# Altium project MVP-Dash-v1.0.PrjPcb (part 4 of 15)

## Sheet RK3568-DDR-PHY.SchDoc
size 420 x 297 mm; SheetNumber: 5; SheetTotal: 25
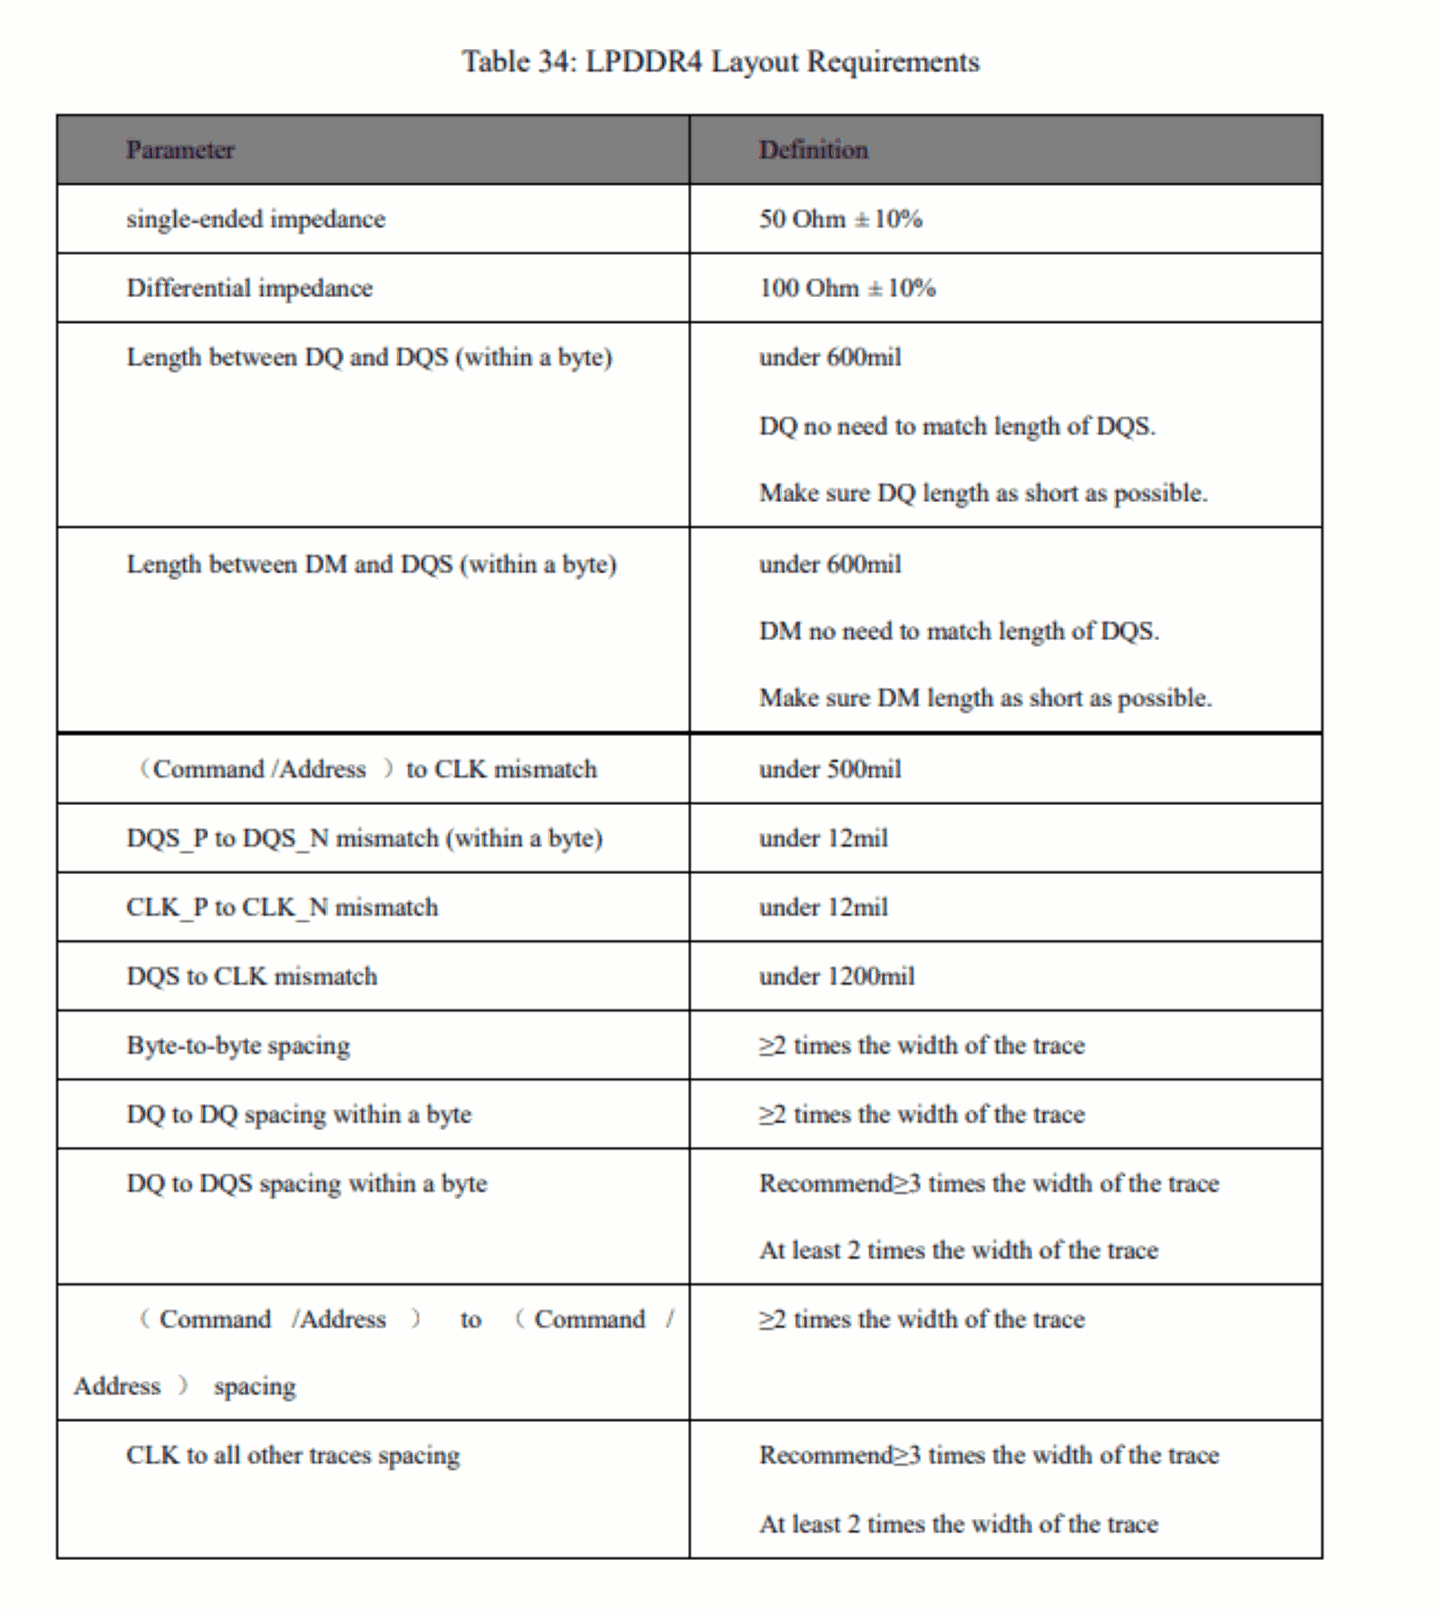
[diagram p4: RK3568-DDR-PHY.SchDoc, left]
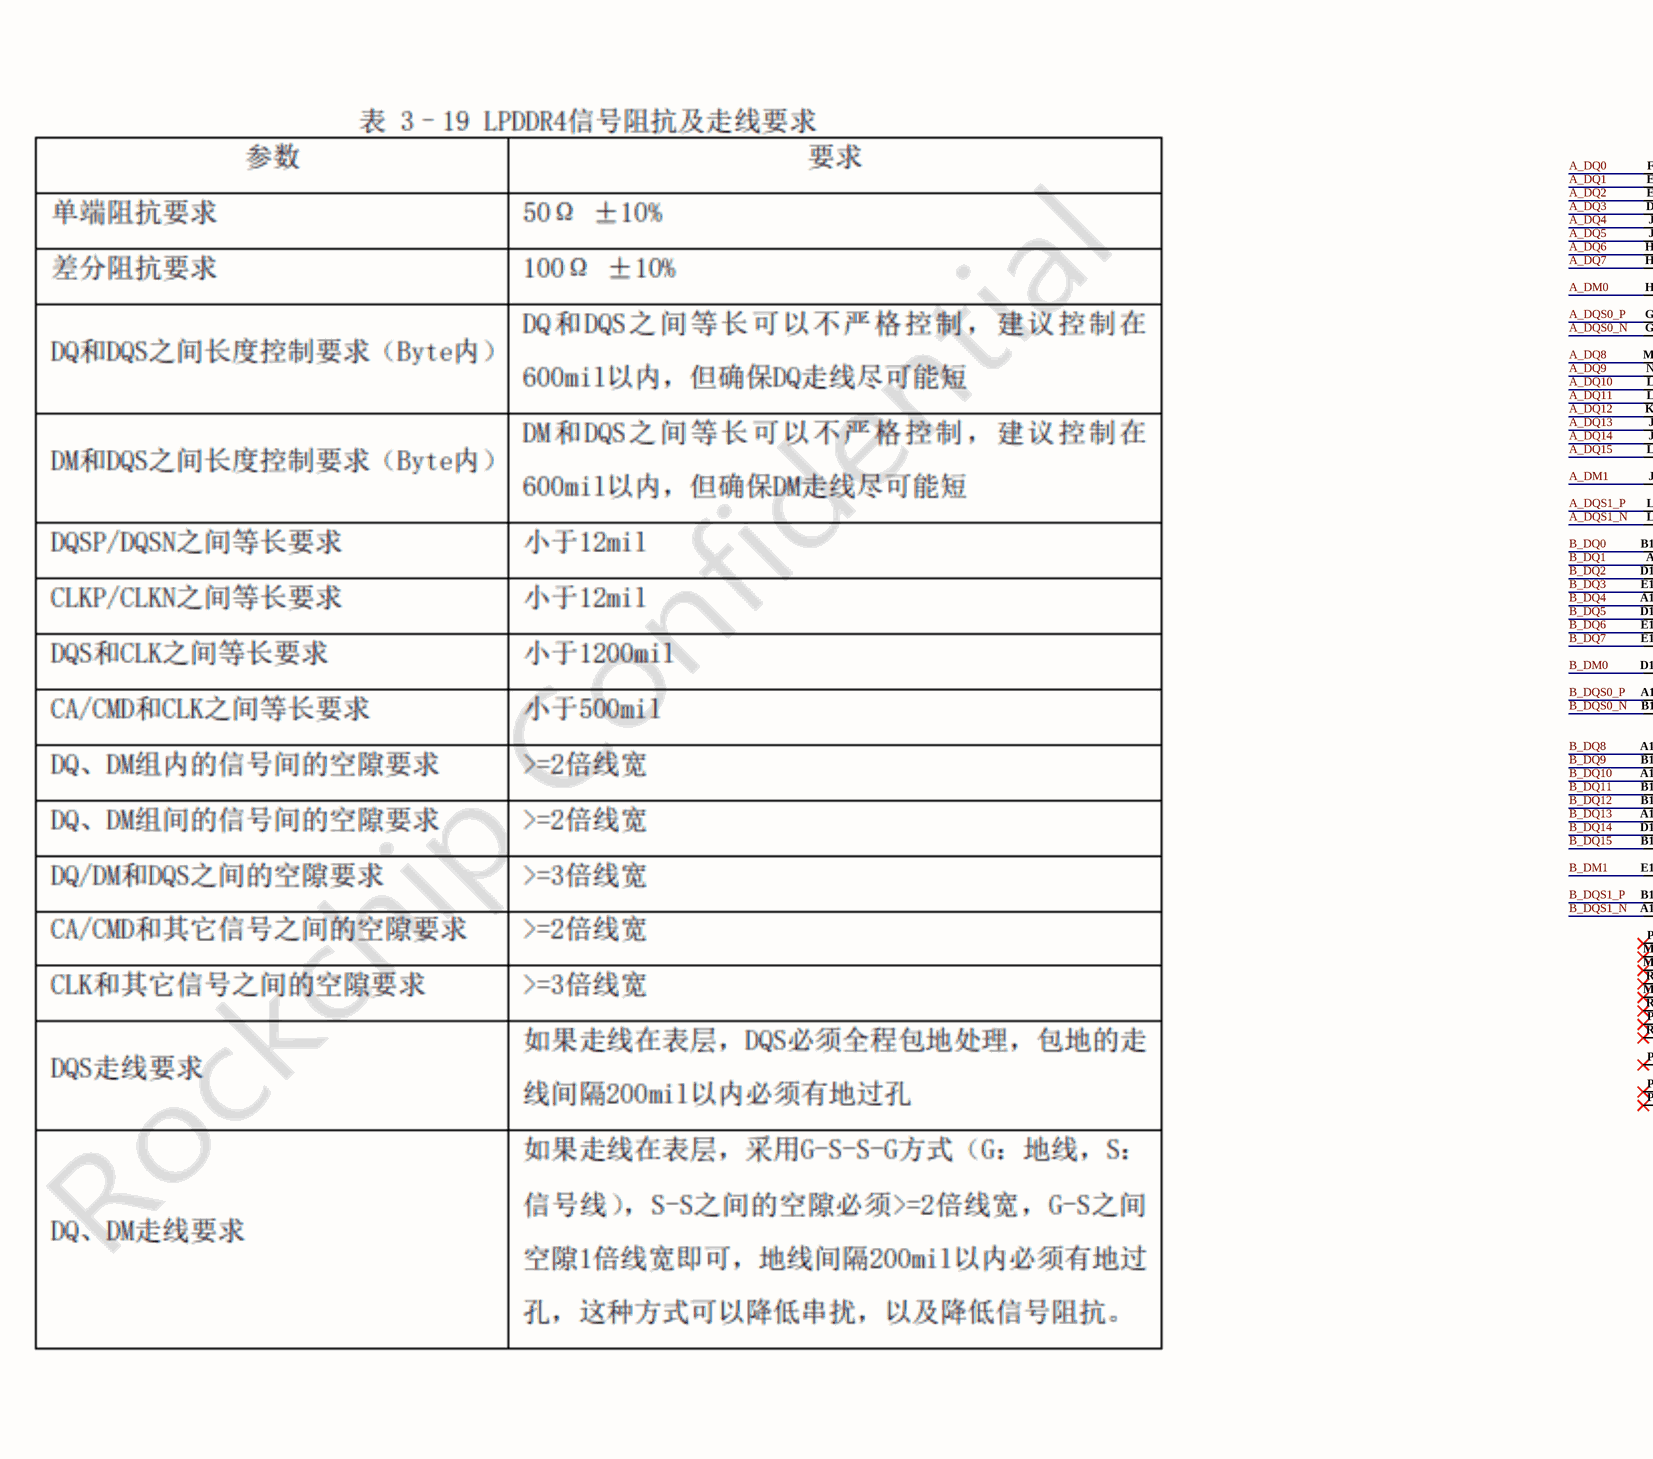
[diagram p5: RK3568-DDR-PHY.SchDoc, middle]
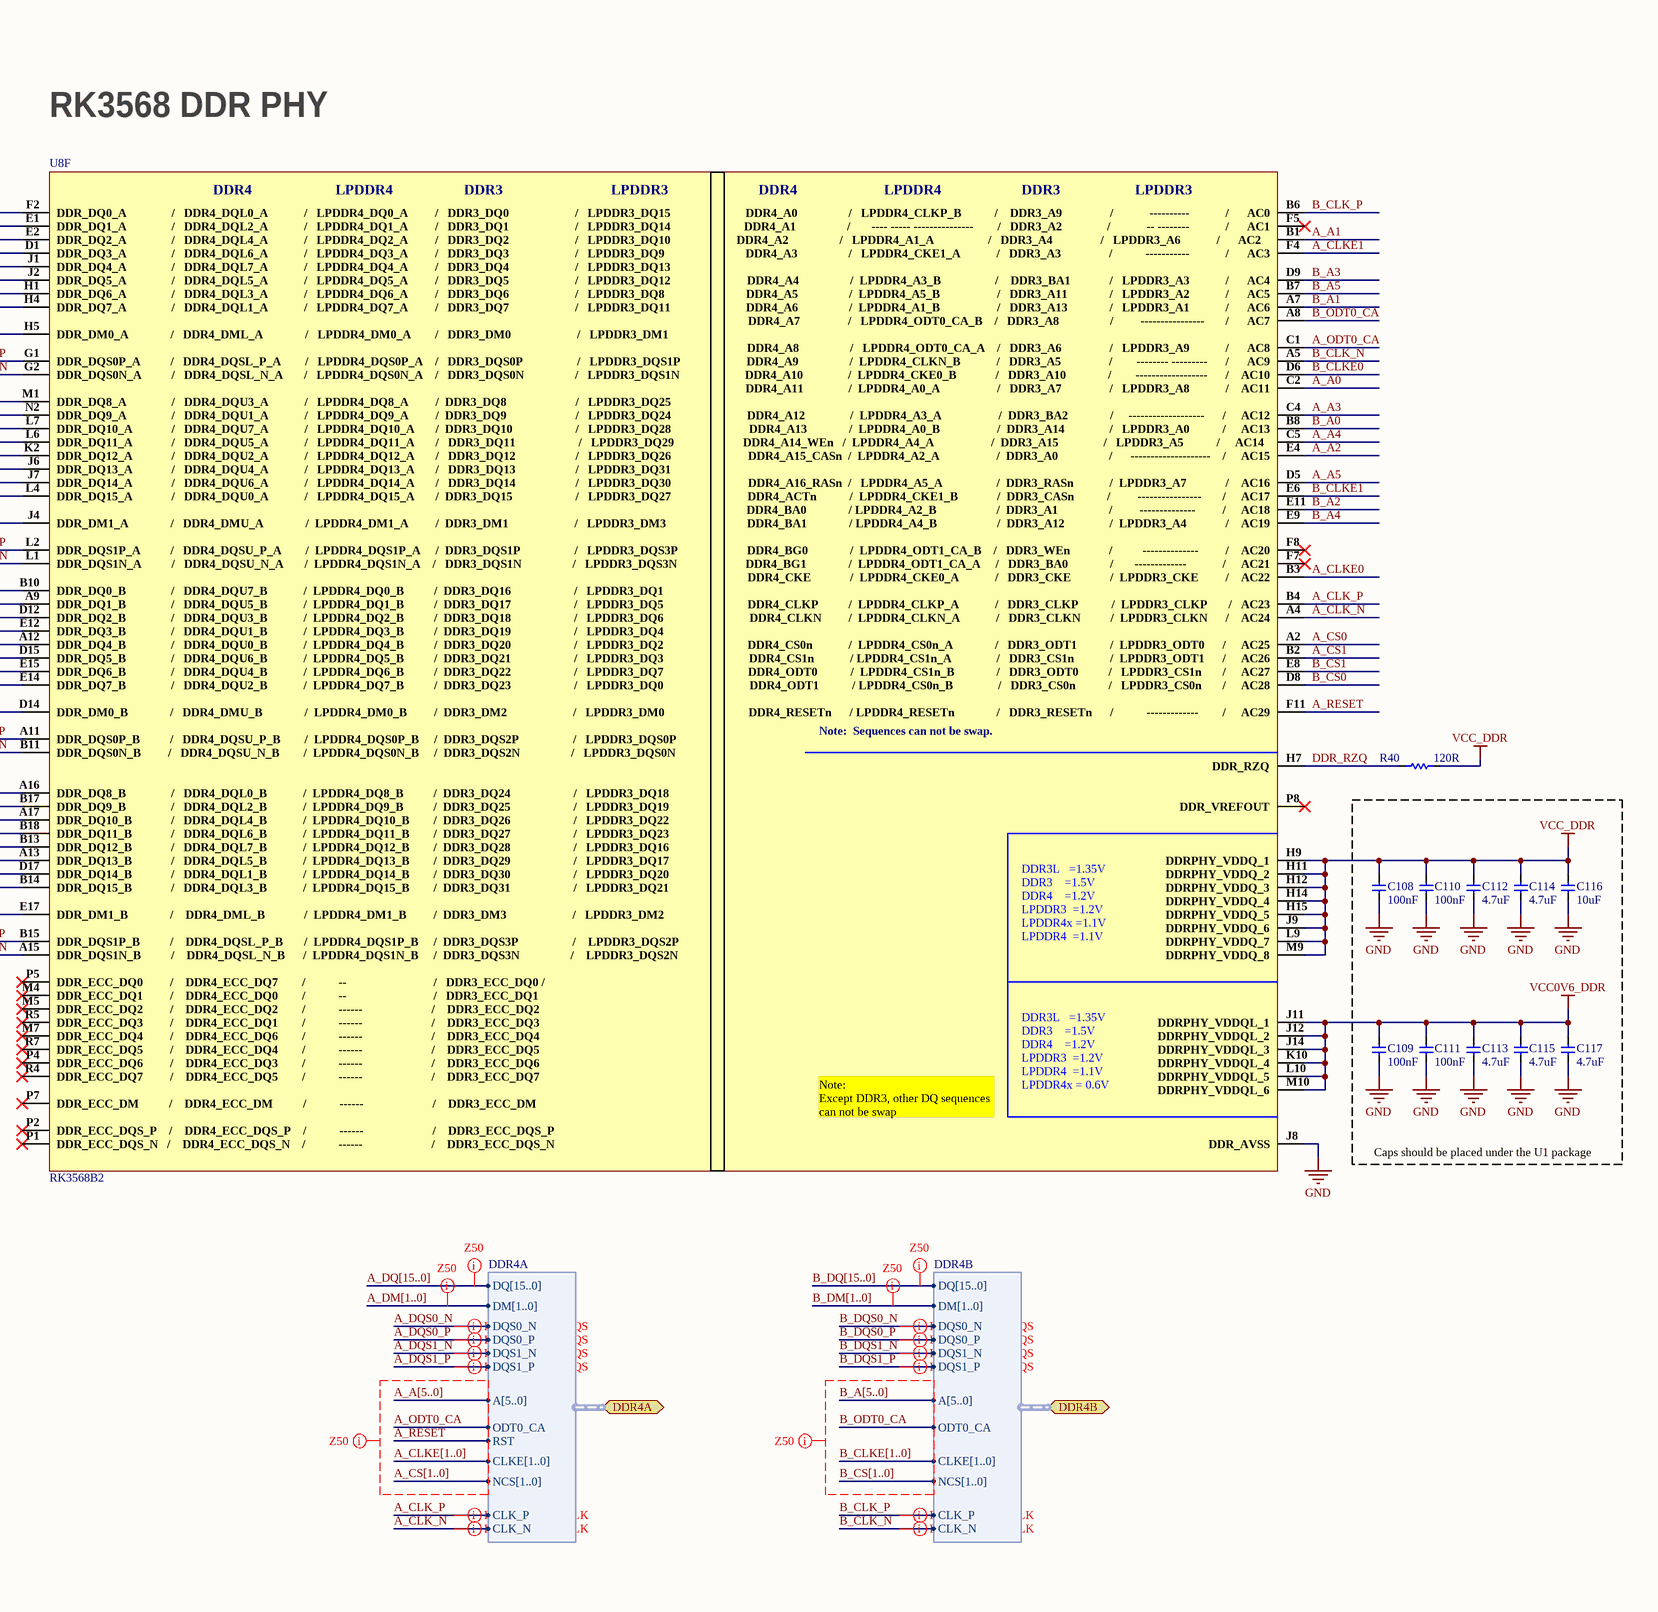
[diagram p6: RK3568-DDR-PHY.SchDoc, right]

### Parts
C108  100nF  [CAP-0201]
C109  100nF  [CAP-0201]
C110  100nF  [CAP-0201]
C111  100nF  [CAP-0201]
C112  4.7uF  [Cap-0402]
C113  4.7uF  [Cap-0402]
C114  4.7uF  [Cap-0402]
C115  4.7uF  [Cap-0402]
C116  10uF  [Cap-0603]
C117  4.7uF  [Cap-0402]
R40  120R  [Res-0201]
U8  RK3568B2  [FCCSP-636L]  (part F of 23)

### Ports
DDR4A (bidir, harness DDR4A, see DRAM-LPDDR4x-Sheet[2A]), DDR4B (bidir, harness DDR4B, see DRAM-LPDDR4x-Sheet[2B])

### Harnesses
DDR4A: DQ[15..0], DM[1..0], DQS0_N, DQS0_P, DQS1_N, DQS1_P, A[5..0], ODT0_CA, RST, CLKE[1..0], NCS[1..0], CLK_P, CLK_N
DDR4B: DQ[15..0], DM[1..0], DQS0_N, DQS0_P, DQS1_N, DQS1_P, A[5..0], ODT0_CA, CLKE[1..0], NCS[1..0], CLK_P, CLK_N

### Nets
GND: C108.1 C109.1 C110.1 C111.1 C112.1 C113.1 C114.1 C115.1 C116.1 C117.1 U8.J8(DDR_AVSS)
VCC0V6_DDR: C109.2 C111.2 C113.2 C115.2 C117.2 U8.J11(DDRPHY_VDDQL_1) U8.J12(DDRPHY_VDDQL_2) U8.J14(DDRPHY_VDDQL_3) U8.K10(DDRPHY_VDDQL_4) U8.L10(DDRPHY_VDDQL_5) U8.M10(DDRPHY_VDDQL_6)
VCC_DDR: C108.2 C110.2 C112.2 C114.2 C116.2 R40.2 U8.H9(DDRPHY_VDDQ_1) U8.H11(DDRPHY_VDDQ_2) U8.H12(DDRPHY_VDDQ_3) U8.H14(DDRPHY_VDDQ_4) U8.H15(DDRPHY_VDDQ_5) U8.J9(DDRPHY_VDDQ_6) U8.L9(DDRPHY_VDDQ_7) U8.M9(DDRPHY_VDDQ_8)
A_A0: U8.C2(DDR4_A11_______________/__LPDDR4_A0_A___________________/___DDR3_A7________________/___LPDDR3_A8____________/____AC11)
A_A1: U8.B1(DDR4_A2_________________/___LPDDR4_A1_A__________________/___DDR3_A4________________/___LPDDR3_A6____________/______AC2)
A_A2: U8.E4(DDR4_A15_CASn__/__LPDDR4_A2_A___________________/__DDR3_A0_________________/______--------------------____/_____AC15)
A_A3: U8.C4(DDR4_A12_______________/__LPDDR4_A3_A___________________/__DDR3_BA2______________/_____-------------------______/_____AC12)
A_A4: U8.C5(DDR4_A14_WEn___/__LPDDR4_A4_A___________________/__DDR3_A15_______________/___LPDDR3_A5___________/_____AC14)
A_A5: U8.D5(DDR4_A16_RASn__/___LPDDR4_A5_A__________________/__DDR3_RASn____________/__LPDDR3_A7_____________/____AC16)
A_CLK_N: U8.A4(DDR4_CLKN_________/__LPDDR4_CLKN_A____________/___DDR3_CLKN__________/__LPDDR3_CLKN______/____AC24) ; port DDR4A.CLK_N
A_CLK_P: U8.B4(DDR4_CLKP__________/__LPDDR4_CLKP_A____________/___DDR3_CLKP___________/__LPDDR3_CLKP_______/___AC23) ; port DDR4A.CLK_P
A_CLKE0: U8.B3(DDR4_CKE_____________/__LPDDR4_CKE0_A____________/___DDR3_CKE_____________/__LPDDR3_CKE_________/____AC22)
A_CLKE1: U8.F4(DDR4_A3_________________/___LPDDR4_CKE1_A____________/___DDR3_A3________________/___________-----------____________/______AC3)
A_CS0: U8.A2(DDR4_CS0n____________/__LPDDR4_CS0n_A______________/___DDR3_ODT1___________/__LPDDR3_ODT0______/_____AC25)
A_CS1: U8.B2(DDR4_CS1n____________/_LPDDR4_CS1n_A_______________/___DDR3_CS1n____________/__LPDDR3_ODT1______/_____AC26)
A_DM0: U8.H5(DDR_DM0_A______________/___DDR4_DML_A______________/___LPDDR4_DM0_A________/___DDR3_DM0______________________/___LPDDR3_DM1)
A_DM1: U8.J4(DDR_DM1_A______________/___DDR4_DMU_A______________/__LPDDR4_DM1_A_________/__DDR3_DM1______________________/___LPDDR3_DM3)
A_DQ0: U8.F2(DDR_DQ0_A_______________/___DDR4_DQL0_A____________/___LPDDR4_DQ0_A_________/___DDR3_DQ0______________________/___LPDDR3_DQ15)
A_DQ1: U8.E1(DDR_DQ1_A_______________/___DDR4_DQL2_A____________/___LPDDR4_DQ1_A_________/___DDR3_DQ1______________________/___LPDDR3_DQ14)
A_DQ2: U8.E2(DDR_DQ2_A_______________/___DDR4_DQL4_A____________/___LPDDR4_DQ2_A_________/___DDR3_DQ2______________________/___LPDDR3_DQ10)
A_DQ3: U8.D1(DDR_DQ3_A_______________/___DDR4_DQL6_A____________/___LPDDR4_DQ3_A_________/___DDR3_DQ3______________________/___LPDDR3_DQ9)
A_DQ4: U8.J1(DDR_DQ4_A_______________/___DDR4_DQL7_A____________/___LPDDR4_DQ4_A_________/___DDR3_DQ4______________________/___LPDDR3_DQ13)
A_DQ5: U8.J2(DDR_DQ5_A_______________/___DDR4_DQL5_A____________/___LPDDR4_DQ5_A_________/___DDR3_DQ5______________________/___LPDDR3_DQ12)
A_DQ6: U8.H1(DDR_DQ6_A_______________/___DDR4_DQL3_A____________/___LPDDR4_DQ6_A_________/___DDR3_DQ6______________________/___LPDDR3_DQ8)
A_DQ7: U8.H4(DDR_DQ7_A_______________/___DDR4_DQL1_A____________/___LPDDR4_DQ7_A_________/___DDR3_DQ7______________________/___LPDDR3_DQ11)
A_DQ8: U8.M1(DDR_DQ8_A_______________/___DDR4_DQU3_A____________/___LPDDR4_DQ8_A_________/__DDR3_DQ8_______________________/___LPDDR3_DQ25)
A_DQ9: U8.N2(DDR_DQ9_A_______________/___DDR4_DQU1_A____________/___LPDDR4_DQ9_A_________/__DDR3_DQ9_______________________/___LPDDR3_DQ24)
A_DQ10: U8.L7(DDR_DQ10_A_____________/___DDR4_DQU7_A____________/___LPDDR4_DQ10_A_______/__DDR3_DQ10_____________________/___LPDDR3_DQ28)
A_DQ11: U8.L6(DDR_DQ11_A_____________/___DDR4_DQU5_A____________/___LPDDR4_DQ11_A_______/___DDR3_DQ11_____________________/___LPDDR3_DQ29)
A_DQ12: U8.K2(DDR_DQ12_A_____________/___DDR4_DQU2_A____________/___LPDDR4_DQ12_A_______/___DDR3_DQ12____________________/___LPDDR3_DQ26)
A_DQ13: U8.J6(DDR_DQ13_A_____________/___DDR4_DQU4_A____________/___LPDDR4_DQ13_A_______/___DDR3_DQ13____________________/___LPDDR3_DQ31)
A_DQ14: U8.J7(DDR_DQ14_A_____________/___DDR4_DQU6_A____________/___LPDDR4_DQ14_A_______/___DDR3_DQ14____________________/___LPDDR3_DQ30)
A_DQ15: U8.L4(DDR_DQ15_A_____________/___DDR4_DQU0_A____________/___LPDDR4_DQ15_A_______/__DDR3_DQ15_____________________/___LPDDR3_DQ27)
A_DQS0_N: U8.G2(DDR_DQS0N_A__________/___DDR4_DQSL_N_A_______/___LPDDR4_DQS0N_A____/___DDR3_DQS0N_________________/___LPDDR3_DQS1N) ; port DDR4A.DQS0_N
A_DQS0_P: U8.G1(DDR_DQS0P_A__________/___DDR4_DQSL_P_A________/___LPDDR4_DQS0P_A____/___DDR3_DQS0P__________________/___LPDDR3_DQS1P) ; port DDR4A.DQS0_P
A_DQS1_N: U8.L1(DDR_DQS1N_A__________/___DDR4_DQSU_N_A_______/__LPDDR4_DQS1N_A____/___DDR3_DQS1N_________________/___LPDDR3_DQS3N) ; port DDR4A.DQS1_N
A_DQS1_P: U8.L2(DDR_DQS1P_A__________/___DDR4_DQSU_P_A________/__LPDDR4_DQS1P_A_____/__DDR3_DQS1P__________________/___LPDDR3_DQS3P) ; port DDR4A.DQS1_P
A_ODT0_CA: U8.C1(DDR4_A8_________________/___LPDDR4_ODT0_CA_A____/___DDR3_A6________________/___LPDDR3_A9____________/______AC8) ; port DDR4A.ODT0_CA
A_RESET: U8.F11(DDR4_RESETn______/_LPDDR4_RESETn______________/___DDR3_RESETn______/___________-------------________/_____AC29) ; port DDR4A.RST
B_A0: U8.B8(DDR4_A13______________/__LPDDR4_A0_B___________________/__DDR3_A14_______________/___LPDDR3_A0___________/_____AC13)
B_A1: U8.A7(DDR4_A6_________________/__LPDDR4_A1_B___________________/___DDR3_A13______________/___LPDDR3_A1____________/______AC6)
B_A2: U8.E11(DDR4_BA0______________/_LPDDR4_A2_B____________________/__DDR3_A1_________________/_________--------------_________/_____AC18)
B_A3: U8.D9(DDR4_A4_________________/__LPDDR4_A3_B__________________/____DDR3_BA1_____________/___LPDDR3_A3____________/______AC4)
B_A4: U8.E9(DDR4_BA1______________/_LPDDR4_A4_B____________________/__DDR3_A12_______________/__LPDDR3_A4_____________/____AC19)
B_A5: U8.B7(DDR4_A5_________________/__LPDDR4_A5_B___________________/___DDR3_A11______________/___LPDDR3_A2____________/______AC5)
B_CLK_N: U8.A5(DDR4_A9_________________/__LPDDR4_CLKN_B____________/___DDR3_A5________________/________--------_---------______/______AC9) ; port DDR4B.CLK_N
B_CLK_P: U8.B6(DDR4_A0_________________/___LPDDR4_CLKP_B___________/____DDR3_A9________________/____________----------____________/______AC0) ; port DDR4B.CLK_P
B_CLKE0: U8.D6(DDR4_A10_______________/__LPDDR4_CKE0_B_____________/___DDR3_A10______________/________------------------______/____AC10)
B_CLKE1: U8.E6(DDR4_ACTn___________/__LPDDR4_CKE1_B_____________/__DDR3_CASn___________/_________----------------_______/_____AC17)
B_CS0: U8.D8(DDR4_ODT1___________/_LPDDR4_CS0n_B_______________/___DDR3_CS0n___________/___LPDDR3_CS0n_______/_____AC28)
B_CS1: U8.E8(DDR4_ODT0___________/__LPDDR4_CS1n_B______________/___DDR3_ODT0__________/___LPDDR3_CS1n_______/_____AC27)
B_DM0: U8.D14(DDR_DM0_B______________/___DDR4_DMU_B______________/__LPDDR4_DM0_B_________/__DDR3_DM2______________________/___LPDDR3_DM0)
B_DM1: U8.E17(DDR_DM1_B______________/____DDR4_DML_B_____________/__LPDDR4_DM1_B_________/__DDR3_DM3______________________/___LPDDR3_DM2)
B_DQ0: U8.B10(DDR_DQ0_B_______________/___DDR4_DQU7_B____________/__LPDDR4_DQ0_B__________/__DDR3_DQ16_____________________/___LPDDR3_DQ1)
B_DQ1: U8.A9(DDR_DQ1_B_______________/___DDR4_DQU5_B____________/__LPDDR4_DQ1_B__________/__DDR3_DQ17_____________________/___LPDDR3_DQ5)
B_DQ2: U8.D12(DDR_DQ2_B_______________/___DDR4_DQU3_B____________/__LPDDR4_DQ2_B__________/__DDR3_DQ18_____________________/___LPDDR3_DQ6)
B_DQ3: U8.E12(DDR_DQ3_B_______________/___DDR4_DQU1_B____________/__LPDDR4_DQ3_B__________/__DDR3_DQ19_____________________/___LPDDR3_DQ4)
B_DQ4: U8.A12(DDR_DQ4_B_______________/___DDR4_DQU0_B____________/__LPDDR4_DQ4_B__________/__DDR3_DQ20_____________________/___LPDDR3_DQ2)
B_DQ5: U8.D15(DDR_DQ5_B_______________/___DDR4_DQU6_B____________/__LPDDR4_DQ5_B__________/__DDR3_DQ21_____________________/___LPDDR3_DQ3)
B_DQ6: U8.E15(DDR_DQ6_B_______________/___DDR4_DQU4_B____________/__LPDDR4_DQ6_B__________/__DDR3_DQ22_____________________/___LPDDR3_DQ7)
B_DQ7: U8.E14(DDR_DQ7_B_______________/___DDR4_DQU2_B____________/__LPDDR4_DQ7_B__________/__DDR3_DQ23_____________________/___LPDDR3_DQ0)
B_DQ8: U8.A16(DDR_DQ8_B_______________/___DDR4_DQL0_B____________/__LPDDR4_DQ8_B__________/__DDR3_DQ24_____________________/___LPDDR3_DQ18)
B_DQ9: U8.B17(DDR_DQ9_B_______________/___DDR4_DQL2_B____________/__LPDDR4_DQ9_B__________/__DDR3_DQ25_____________________/___LPDDR3_DQ19)
B_DQ10: U8.A17(DDR_DQ10_B_____________/___DDR4_DQL4_B____________/__LPDDR4_DQ10_B________/__DDR3_DQ26_____________________/___LPDDR3_DQ22)
B_DQ11: U8.B18(DDR_DQ11_B_____________/___DDR4_DQL6_B____________/__LPDDR4_DQ11_B________/__DDR3_DQ27_____________________/___LPDDR3_DQ23)
B_DQ12: U8.B13(DDR_DQ12_B_____________/___DDR4_DQL7_B____________/__LPDDR4_DQ12_B________/__DDR3_DQ28_____________________/___LPDDR3_DQ16)
B_DQ13: U8.A13(DDR_DQ13_B_____________/___DDR4_DQL5_B____________/__LPDDR4_DQ13_B________/__DDR3_DQ29_____________________/___LPDDR3_DQ17)
B_DQ14: U8.D17(DDR_DQ14_B_____________/___DDR4_DQL1_B____________/__LPDDR4_DQ14_B________/__DDR3_DQ30_____________________/___LPDDR3_DQ20)
B_DQ15: U8.B14(DDR_DQ15_B_____________/___DDR4_DQL3_B____________/__LPDDR4_DQ15_B________/__DDR3_DQ31_____________________/___LPDDR3_DQ21)
B_DQS0_N: U8.B11(DDR_DQS0N_B_________/___DDR4_DQSU_N_B________/__LPDDR4_DQS0N_B_____/__DDR3_DQS2N_________________/___LPDDR3_DQS0N) ; port DDR4B.DQS0_N
B_DQS0_P: U8.A11(DDR_DQS0P_B__________/___DDR4_DQSU_P_B________/__LPDDR4_DQS0P_B_____/__DDR3_DQS2P__________________/___LPDDR3_DQS0P) ; port DDR4B.DQS0_P
B_DQS1_N: U8.A15(DDR_DQS1N_B__________/____DDR4_DQSL_N_B______/__LPDDR4_DQS1N_B_____/__DDR3_DQS3N_________________/____LPDDR3_DQS2N) ; port DDR4B.DQS1_N
B_DQS1_P: U8.B15(DDR_DQS1P_B__________/____DDR4_DQSL_P_B_______/__LPDDR4_DQS1P_B_____/__DDR3_DQS3P__________________/____LPDDR3_DQS2P) ; port DDR4B.DQS1_P
B_ODT0_CA: U8.A8(DDR4_A7________________/___LPDDR4_ODT0_CA_B____/___DDR3_A8_________________/_________----------------_______/______AC7) ; port DDR4B.ODT0_CA
DDR_RZQ: R40.1 U8.H7(DDR_RZQ)

Not connected (* = marked no-connect by the designer): U8 F5(DDR4_A1_________________/_______----_-----_---------------________/___DDR3_A2_______________/____________--_--------____________/______AC1)* F7(DDR4_BG1______________/__LPDDR4_ODT1_CA_A_____/___DDR3_BA0______________/_______-------------____________/_____AC21)* F8(DDR4_BG0______________/__LPDDR4_ODT1_CA_B____/___DDR3_WEn_____________/__________--------------_________/____AC20)* M4(DDR_ECC_DQ1_________/____DDR4_ECC_DQ0________/___________--_____________________________/___DDR3_ECC_DQ1)* M5(DDR_ECC_DQ2_________/____DDR4_ECC_DQ2________/___________------_______________________/____DDR3_ECC_DQ2)* M7(DDR_ECC_DQ4_________/____DDR4_ECC_DQ6________/___________------_______________________/____DDR3_ECC_DQ4)* P1(DDR_ECC_DQS_N___/____DDR4_ECC_DQS_N____/___________------_______________________/____DDR3_ECC_DQS_N)* P2(DDR_ECC_DQS_P____/____DDR4_ECC_DQS_P____/___________------_______________________/____DDR3_ECC_DQS_P)* P4(DDR_ECC_DQ6_________/____DDR4_ECC_DQ3________/___________------_______________________/____DDR3_ECC_DQ6)* P5(DDR_ECC_DQ0_________/____DDR4_ECC_DQ7________/___________--_____________________________/___DDR3_ECC_DQ0_/________)* P7(DDR_ECC_DM__________/____DDR4_ECC_DM__________/___________------_______________________/____DDR3_ECC_DM)* P8(DDR_VREFOUT)* R4(DDR_ECC_DQ7_________/____DDR4_ECC_DQ5________/___________------_______________________/____DDR3_ECC_DQ7)* R5(DDR_ECC_DQ3_________/____DDR4_ECC_DQ1________/___________------_______________________/____DDR3_ECC_DQ3)* R7(DDR_ECC_DQ5_________/____DDR4_ECC_DQ4________/___________------_______________________/____DDR3_ECC_DQ5)*

### Buses and harness runs
bus A_A[5..0]
bus A_CLKE[1..0]
bus A_CS[1..0]
bus A_DM[1..0]
bus A_DQ[15..0]
bus B_A[5..0]
bus B_CLKE[1..0]
bus B_CS[1..0]
bus B_DM[1..0]
bus B_DQ[15..0]

### Layout directives
net class 50OHM_DDR: (no net found under the mark), A_A[5..0], A_CLKE[1..0], A_CS[1..0], A_ODT0_CA, A_RESET, B_A[5..0], B_CLKE[1..0], B_CS[1..0], B_ODT0_CA
differential pair; differential pair class 100OHM_DDR_DQS: A_DQS0_N, A_DQS0_P, A_DQS1_N, A_DQS1_P, B_DQS0_N, B_DQS0_P, B_DQS1_N, B_DQS1_P
differential pair; differential pair class 100OHM_DDR_CLK: A_CLK_N, A_CLK_P, B_CLK_N, B_CLK_P

### Notes on the sheet
- RK3568 DDR PHY
- Caps should be placed under the U1 package
- File:
- Title:
- Date:
- Page
- Num:
- Total:
- Drawn By: Huzaifa Ali
- (in symbol RK3568B2, part F) DDR4; LPDDR4; DDR3; LPDDR3; Note:  Sequences can not be swap.; DDR3L   =1.35V / DDR3    =1.5V / DDR4    =1.2V / LPDDR3  =1.2V / LPDDR4x =1.1V / LPDDR4  =1.1V; DDR3L   =1.35V / DDR3    =1.5V / DDR4    =1.2V / LPDDR3  =1.2V / LPDDR4  =1.1V / LPDDR4x = 0.6V /; Note: / Except DDR3, other DQ sequences / can not be swap

### Library data of the parts
C108-C111 = CC0201KRX5R6BB104: as C89 on sheet RK3568-Power-Sheet; Supplier 1: Mouser; Manufacturer Part Number: CC0201KRX5R6BB104; RoHS: Yes; Category: Ceramic Capacitors; Stock 1: 824403; Pricing 1: 1=0.10000, 10=0.02400, 50=0.02400, 100=0.01900, 1000=0.01100, 10000=0.00900 (USD); Mount: Surface Mount; Case/Package: 0201; Case Code (Imperial): 0201; Case Code (Metric): 0603; Weight: 6E-06oz; Min Operating Temperature: -55°C; Max Operating Temperature: 85°C; Capacitance: 100nF; Dielectric: X5R; Voltage Rating (DC): 10V; Packaging: Tape and Reel; Termination: SMD/SMT; Resistor Type: Ceramic; Voltage Rating: 10V; Series: CC; Construction: Flat; Length: 0.6mm; Width: 0.012inch; Height: 0.3mm; Thickness: 0.013inch; Depth: 0.3mm; Radiation Hardening: No; Lead Free: Lead Free; Halogen Free: Halogen Free; RoHS Compliant: Yes; ComponentLink1URL: https://datasheet.ciiva.com/11587/upy-gphc-x5r-4v-to-50v-12-11587190.pdf?src-supplier=Avnet; ComponentLink1Description: https://datasheet.ciiva.com/11587/upy-gphc-x5r-4v-to-50v-12-11587190.pdf?src-supplier=Avnet; Supplier Part Number 1: 603-CC201KRX5R6BB104; LCSC Part Number: C190183
C112-C115 C117 = CC0402KRX5R5BB475: CAP CER 4.7UF 6.3V X5R 0402; Manufacturer: Yageo; Tolerance: 10%; Item Type: Capacitor; Supplier 1: Arrow Electronics; Manufacturer Part Number: CC0402KRX5R5BB475; RoHS: Yes; Category: Ceramic Capacitors; Stock 1: 890000; Pricing 1: 10000=0.02120, 20000=0.02030, 30000=0.02010, 50000=0.01930, 100000=0.01760, 250000=0.01630 (USD); Case/Package: 0402; Voltage Rating (DC): 6.3V; Dielectric: X5R; Capacitance: 4.7uF; Lead Free: Lead Free; Halogen Free: Halogen Free; RoHS Compliant: Yes; ComponentLink1URL: http://www.yageo.com/documents/recent/UPY-GPHC_X5R_4V-to-50V_25.pdf?src-supplier=Digi-Key; ComponentLink1Description: http://www.yageo.com/documents/recent/UPY-GPHC_X5R_4V-to-50V_25.pdf?src-supplier=Digi-Key; ComponentLink2URL: https://www.yageo.com/upload/media/product/productsearch/datasheet/mlcc/UPY-GPHC_X5R_4V-to-50V_26.pdf?src-supplier=Digi-Key; ComponentLink2Description: https://www.yageo.com/upload/media/product/productsearch/datasheet/mlcc/UPY-GPHC_X5R_4V-to-50V_26.pdf?src-supplier=Digi-Key; LCSC Part Number: C541466; Supplier Part Number 1: CC0402KRX5R5BB475
C116 = GRM188R60J106ME47D: CAP CER 10UF 6.3V X5R 0603; Manufacturer: Murata; Material: Ceramic; Tolerance: 20%; Item Type: Capacitor; Supplier 1: Avnet; Manufacturer Part Number: GRM188R60J106ME47D; RoHS: Yes; Category: Ceramic Capacitors; Stock 1: 513625; Pricing 1: 4000=0.02461, 8000=0.02328, 16000=0.02195, 24000=0.02062, 32000=0.01929, 40000=0.01796, 400000=0.01663 (USD); Mount: Surface Mount; Case/Package: 0603; Case Code (Metric): 1608; Case Code (Imperial): 0603; Weight: 0.000222oz; Min Operating Temperature: -55°C; Max Operating Temperature: 85°C; Capacitance: 10uF; Dielectric: X5R; Packaging: Cut Tape; Package Quantity: 4000; Voltage Rating: 6.3V; Voltage Rating (DC): 6.3V; Termination: Standard; Voltage: 6.3V; Series: GRM; Length: 1.6mm; Width: 0.8mm; Height: 0.8mm; Thickness: 0.035inch; Depth: 0.8mm; Radiation Hardening: No; Reach SVHC Compliant: Yes; Lead Free: Lead Free; RoHS Compliant: Yes; ComponentLink1URL: https://datasheet.ciiva.com/22776/1747457-22776418.pdf?src-supplier=Farnell; ComponentLink1Description: https://datasheet.ciiva.com/22776/1747457-22776418.pdf?src-supplier=Farnell; ComponentLink2URL: https://datasheet.ciiva.com/28584/415295-28584232.pdf?src-supplier=Element14; ComponentLink2Description: https://datasheet.ciiva.com/28584/415295-28584232.pdf?src-supplier=Element14; ComponentLink3URL: https://datasheet.ciiva.com/3777/10175grm188r60j106me4723-3777268.pdf?src-supplier=Arrow+Electronics; ComponentLink3Description: https://datasheet.ciiva.com/3777/10175grm188r60j106me4723-3777268.pdf?src-supplier=Arrow+Electronics; ComponentLink4URL: https://datasheet.ciiva.com/29202/450781-da-01-de-vs-chip-kond-0603-10-0-uf-20pr-6-3v-x5r-29202806.pdf?src-supplier=Conrad; ComponentLink4Description: https://datasheet.ciiva.com/29202/450781-da-01-de-vs-chip-kond-0603-10-0-uf-20pr-6-3v-x5r-29202806.pdf?src-supplier=Conrad; ComponentLink5URL: https://datasheet.ciiva.com/29199/454401-da-01-en-vs-kondensator-0603-29199677.pdf?src-supplier=Conrad; ComponentLink5Description: https://datasheet.ciiva.com/29199/454401-da-01-en-vs-kondensator-0603-29199677.pdf?src-supplier=Conrad; ComponentLink6URL: https://datasheet.ciiva.com/14116/grmseries-highdielectrictype-eng-14116428.pdf?src-supplier=Distrelec; ComponentLink6Description: https://datasheet.ciiva.com/14116/grmseries-highdielectrictype-eng-14116428.pdf?src-supplier=Distrelec; ComponentLink7URL: https://datasheet.ciiva.com/138/partnumbering-e-01-138659.pdf?src-supplier=Digi-Key; ComponentLink7Description: https://datasheet.ciiva.com/138/partnumbering-e-01-138659.pdf?src-supplier=Digi-Key; ComponentLink8URL: https://datasheet.ciiva.com/138/partnumbering-e-01-138658.pdf?src-supplier=Digi-Key; ComponentLink8Description: https://datasheet.ciiva.com/138/partnumbering-e-01-138658.pdf?src-supplier=Digi-Key; ComponentLink9URL: https://datasheet.ciiva.com/138/partnumbering-e-01-138660.pdf?src-supplier=Digi-Key; ComponentLink9Description: https://datasheet.ciiva.com/138/partnumbering-e-01-138660.pdf?src-supplier=Digi-Key; ComponentLink10URL: https://datasheet.ciiva.com/16373/l0005e-16373580.pdf?src-supplier=Future+Electronics; ComponentLink10Description: https://datasheet.ciiva.com/16373/l0005e-16373580.pdf?src-supplier=Future+Electronics; Supplier Part Number 1: GRM188R60J106ME47D; LCSC Part Number: C77041
R40 = RC0201FR-07120RL: RES 120 OHM 1% 1/20W 0201; Manufacturer: Yageo; Item Type: Resistor; Supplier: Digikey; Supplier Part Number: 311-120MCT-ND; Manufacturer Part Number: RC0201FR-07120RL; RoHS: Yes; Category: Chip SMD Resistors; Stock: 38339; Pricing: 1=0.1, 10=0.027, 50=0.0172, 100=0.0143, 500=0.00988, 1000=0.00854, 5000=0.00629 (USD); Lead Free: 5697LeadFree; ComponentLink1URL: https://datasheet.ciiva.com/2525/pyu-r-int-thick-7-2525064.pdf?src-supplier=Digikey; ComponentLink1Description: https://datasheet.ciiva.com/2525/pyu-r-int-thick-7-2525064.pdf?src-supplier=Digikey; ComponentLink2URL: https://datasheet.ciiva.com/22661/1563626-22661285.pdf?src-supplier=Element14; ComponentLink2Description: https://datasheet.ciiva.com/22661/1563626-22661285.pdf?src-supplier=Element14; ComponentLink3URL: https://datasheet.ciiva.com/2525/pyu-r-int-thick-7-2525062.pdf?src-supplier=Digikey; ComponentLink3Description: https://datasheet.ciiva.com/2525/pyu-r-int-thick-7-2525062.pdf?src-supplier=Digikey; ComponentLink4URL: https://datasheet.ciiva.com/2525/pyu-r-int-thick-7-2525063.pdf?src-supplier=Digikey; ComponentLink4Description: https://datasheet.ciiva.com/2525/pyu-r-int-thick-7-2525063.pdf?src-supplier=Digikey; LCSC Part Number: C295718
U8 = RK3568B2: as U8 on sheet RK3568-Power-Sheet; Manufacturer Part Number: RK3568B2; Package: FCCSP-636L; LCSC Part Number: C3345225

## Sheet RK3568-OSC-PMUIO-Sheet.SchDoc
size 420 x 297 mm; SheetNumber: 6; SheetTotal: 25
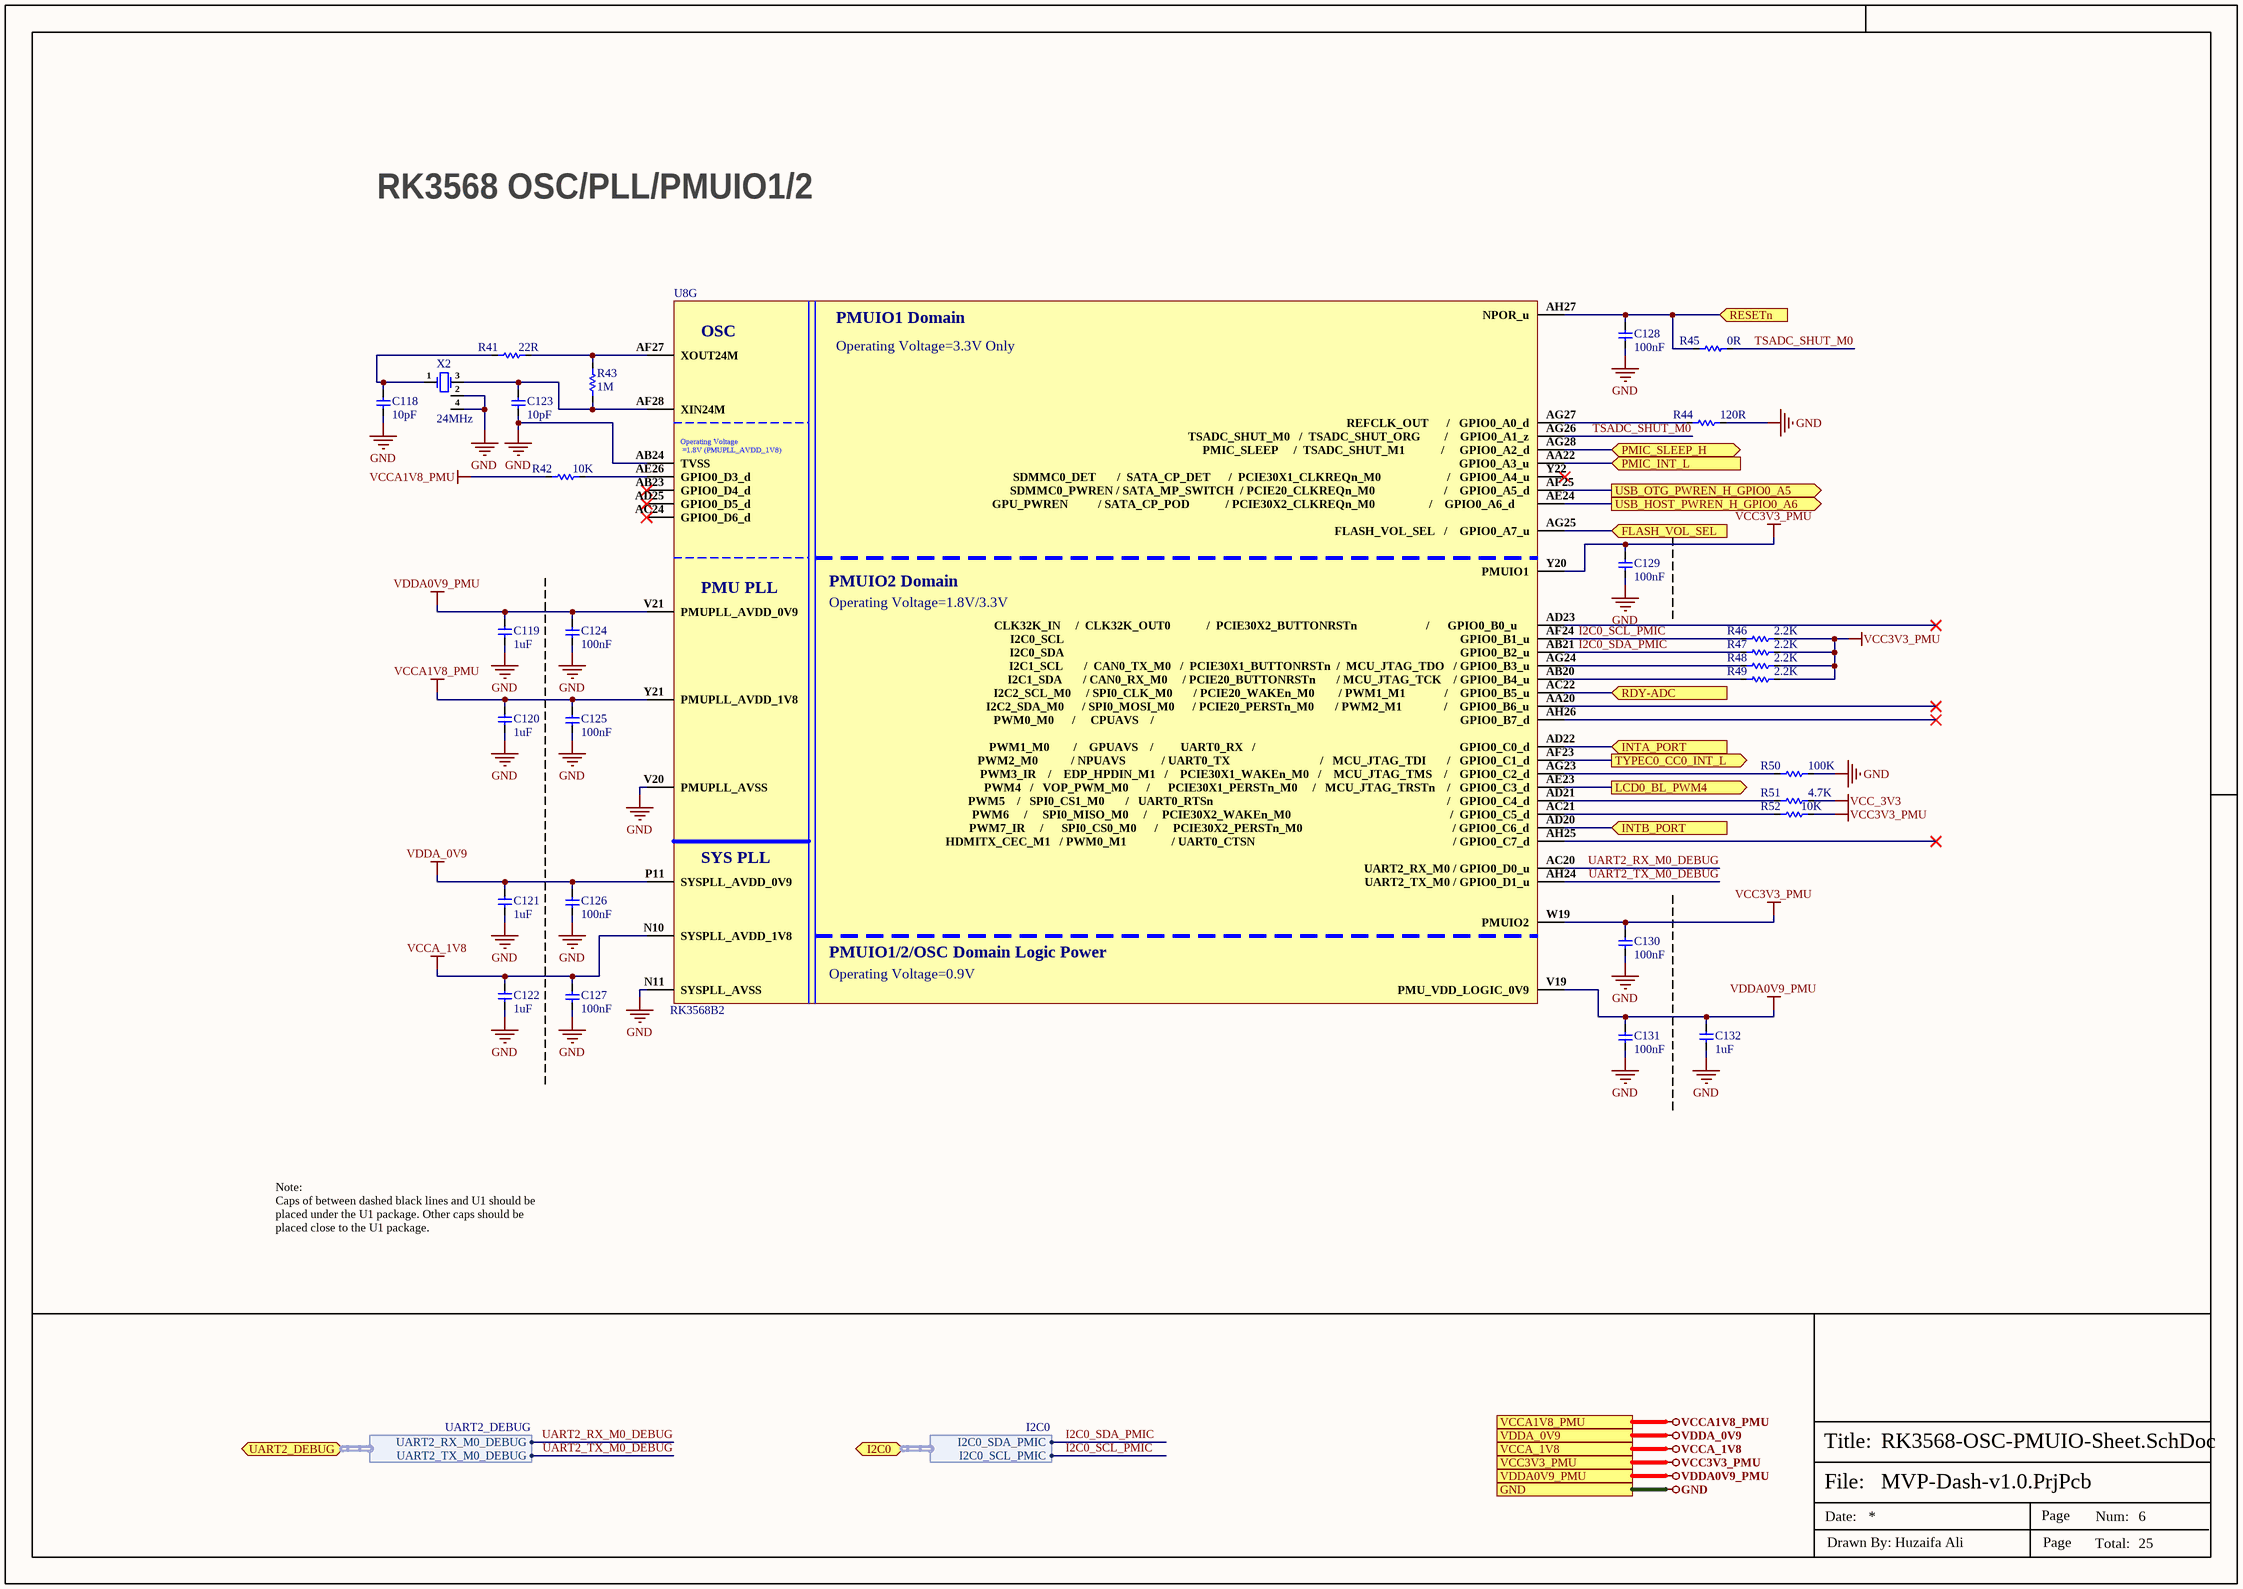
[diagram p7: RK3568-OSC-PMUIO-Sheet.SchDoc]

### Parts
C118  10pF  [Cap-0402]
C119  1uF  [Cap-0402]
C120  1uF  [Cap-0402]
C121  1uF  [Cap-0402]
C122  1uF  [Cap-0402]
C123  10pF  [Cap-0402]
C124  100nF  [CAP-0201]
C125  100nF  [CAP-0201]
C126  100nF  [CAP-0201]
C127  100nF  [CAP-0201]
C128  100nF  [CAP-0201]
C129  100nF  [CAP-0201]
C130  100nF  [CAP-0201]
C131  100nF  [CAP-0201]
C132  1uF  [Cap-0402]
R41  22R  [Res-0402]
R42  10K  [Res-0402]
R43  1M  [Res-0402]
R44  120R  [Res-0201]
R45  0R  [Res-0402]
R46  2.2K  [Res-0402]
R47  2.2K  [Res-0402]
R48  2.2K  [Res-0402]
R49  2.2K  [Res-0402]
R50  100K  [Res-0402]
R51  4.7K  [Res-0402]
R52  10K  [Res-0402]
U8  RK3568B2  [FCCSP-636L]  (part G of 23)
X2  24MHz  [SMD3225-4P]

### Ports
FLASH_VOL_SEL (in, see Power-Others-Sheet[1D]), GND (see CAN-Bus-SPI-Flash-Sheet[4D], Connector-Sheet[5D], DRAM-LPDDR4x-Sheet[4D], eMMC-Sheet[4D], LED-Debug-Sheet[4D], Power-DC-IN-Sheet[4D], Power-Others-Sheet[4D], Power-PMIC-Sheet[4D], RK3568-Audio-Interface[4D], RK3568-Flash-SD-Controller[4D], RK3568-Power-Sheet[4D], RK3568-SARADC-GPIO[4D], RK3568-USB-PCIe-Sheet[5D], RK3568-VI-Interface-Sheet[4D], RK3568-VO-Interface-1[4D], RK3568-VO-Interface-2[4D], Sensors-Sheet-1[4D], Sensors-Sheet-2[5D], Type-C-Sheet[4D], USB-Ports[4D], VO-HDMI2.0-TX-Sheet[4D], VO-LCM-MIPI-DSI-TX0[4D], WIFI-BT-SDIO-Sheet[4D]), I2C0 (bidir, harness I2C0, see Power-Others-Sheet[3D], Power-PMIC-Sheet[2D], Type-C-Sheet[2D]), INTA_PORT (in, see Sensors-Sheet-2[5D]), INTB_PORT (in, see Sensors-Sheet-2[5D]), LCD0_BL_PWM4 (out, see VO-LCM-MIPI-DSI-TX0[3D]), PMIC_INT_L (in, see Power-PMIC-Sheet[1D]), PMIC_SLEEP_H (bidir, see Power-Others-Sheet[1D], Power-PMIC-Sheet[1D]), RDY-ADC (in, see Sensors-Sheet-1[5B]), RESETn (in, see Power-PMIC-Sheet[1D]), TYPEC0_CC0_INT_L (out, see Type-C-Sheet[3D]), UART2_DEBUG (bidir, harness UART2_DEBUG, see LED-Debug-Sheet[1D]), USB_HOST_PWREN_H_GPIO0_A6 (out, see USB-Ports[1B]), USB_OTG_PWREN_H_GPIO0_A5 (out, see Type-C-Sheet[1B]), VCC3V3_PMU (see Power-Others-Sheet[4D], Power-PMIC-Sheet[4D], Type-C-Sheet[4D]), VCCA1V8_PMU (see DRAM-LPDDR4x-Sheet[4D], Power-PMIC-Sheet[4D]), VCCA_1V8 (see LED-Debug-Sheet[4D], Power-PMIC-Sheet[4D], RK3568-SARADC-GPIO[4D], RK3568-USB-PCIe-Sheet[5D]), VDDA0V9_PMU (see Power-PMIC-Sheet[3D]), VDDA_0V9 (see Power-PMIC-Sheet[3D], RK3568-USB-PCIe-Sheet[5D])

### Harnesses
UART2_DEBUG: UART2_RX_M0_DEBUG, UART2_TX_M0_DEBUG
I2C0: I2C0_SDA_PMIC, I2C0_SCL_PMIC

### Nets
GND: C118.1 C119.2 C120.2 C121.2 C122.2 C123.1 C124.1 C125.1 C126.1 C127.1 C128.1 C129.1 C130.1 C131.1 C132.2 R44.2 R50.2 U8.AB24(TVSS) U8.N11(SYSPLL_AVSS) U8.V20(PMUPLL_AVSS) X2.2(GND) X2.4(GND) ; port GND
VCC3V3_PMU: C129.2 C130.2 R46.2 R47.2 R48.2 R49.2 R52.1 U8.W19(PMUIO2) U8.Y20(PMUIO1) ; port VCC3V3_PMU
VCC_3V3: R51.2
VCCA1V8_PMU: C120.1 C125.2 R42.2 U8.Y21(PMUPLL_AVDD_1V8) ; port VCCA1V8_PMU
VCCA_1V8: C122.1 C127.2 U8.N10(SYSPLL_AVDD_1V8) ; port VCCA_1V8
VDDA0V9_PMU: C119.1 C124.2 C131.2 C132.1 U8.V19(PMU_VDD_LOGIC_0V9) U8.V21(PMUPLL_AVDD_0V9) ; port VDDA0V9_PMU
VDDA_0V9: C121.1 C126.2 U8.P11(SYSPLL_AVDD_0V9) ; port VDDA_0V9
FLASH_VOL_SEL: U8.AG25(FLASH_VOL_SEL___/____GPIO0_A7_u) ; port FLASH_VOL_SEL
I2C0_SCL_PMIC: R46.1 U8.AF24(I2C0_SCL____________________________________________________________________________________________________________________________________GPIO0_B1_u) ; port I2C0.I2C0_SCL_PMIC
I2C0_SDA_PMIC: R47.1 U8.AB21(I2C0_SDA____________________________________________________________________________________________________________________________________GPIO0_B2_u) ; port I2C0.I2C0_SDA_PMIC
INTA_PORT: U8.AD22(PWM1_M0________/____GPUAVS____/_________UART0_RX___/____________________________________________________________________GPIO0_C0_d) ; port INTA_PORT
INTB_PORT: U8.AD20(PWM7_IR_____/______SPI0_CS0_M0______/_____PCIE30X2_PERSTn_M0__________________________________________________/_GPIO0_C6_d) ; port INTB_PORT
LCD0_BL_PWM4: U8.AE23(PWM4___/___VOP_PWM_M0______/______PCIE30X1_PERSTn_M0_____/___MCU_JTAG_TRSTn____/___GPIO0_C3_d) ; port LCD0_BL_PWM4
PMIC_INT_L: U8.AA22(GPIO0_A3_u) ; port PMIC_INT_L
PMIC_SLEEP_H: U8.AG28(PMIC_SLEEP_____/__TSADC_SHUT_M1____________/_____GPIO0_A2_d) ; port PMIC_SLEEP_H
RESETn: C128.2 R45.1 U8.AH27(NPOR_u) ; port RESETn
TSADC_SHUT_M0: R45.2 U8.AG26(TSADC_SHUT_M0___/__TSADC_SHUT_ORG________/____GPIO0_A1_z)
TYPEC0_CC0_INT_L: U8.AF23(PWM2_M0___________/_NPUAVS____________/_UART0_TX______________________________/___MCU_JTAG_TDI_______/___GPIO0_C1_d) ; port TYPEC0_CC0_INT_L
UART2_RX_M0_DEBUG: U8.AC20(UART2_RX_M0_/_GPIO0_D0_u) ; port UART2_DEBUG.UART2_RX_M0_DEBUG
UART2_TX_M0_DEBUG: U8.AH24(UART2_TX_M0_/_GPIO0_D1_u) ; port UART2_DEBUG.UART2_TX_M0_DEBUG
NetC118_2: C118.2 R41.2 X2.1(OSC1)
NetC123_2: C123.2 R43.1 U8.AF28(XIN24M) X2.3(OSC2)
NetR41_1: R41.1 R43.2 U8.AF27(XOUT24M)
NetR42_1: R42.1 U8.AE26(GPIO0_D3_d)
NetR44_1: R44.1 U8.AG27(REFCLK_OUT______/___GPIO0_A0_d)
NetR48_1: R48.1 U8.AG24(I2C1_SCL_______/__CAN0_TX_M0___/__PCIE30X1_BUTTONRSTn__/__MCU_JTAG_TDO___/_GPIO0_B3_u)
NetR49_1: R49.1 U8.AB20(I2C1_SDA_______/_CAN0_RX_M0_____/_PCIE20_BUTTONRSTn_______/_MCU_JTAG_TCK____/_GPIO0_B4_u)
NetR50_1: R50.1 U8.AG23(PWM3_IR____/____EDP_HPDIN_M1___/____PCIE30X1_WAKEn_M0___/____MCU_JTAG_TMS____/____GPIO0_C2_d)
NetR51_1: R51.1 U8.AD21(PWM5____/___SPI0_CS1_M0_______/___UART0_RTSn______________________________________________________________________________/___GPIO0_C4_d)
NetR52_2: R52.2 U8.AC21(PWM6_____/_____SPI0_MISO_M0_____/_____PCIE30X2_WAKEn_M0_____________________________________________________/__GPIO0_C5_d)
NetR84_1: U8.AE24(GPU_PWREN__________/_SATA_CP_POD____________/_PCIE30X2_CLKREQn_M0__________________/____GPIO0_A6_d) ; port USB_HOST_PWREN_H_GPIO0_A6
NetR163_2: U8.AF25(SDMMC0_PWREN_/_SATA_MP_SWITCH__/_PCIE20_CLKREQn_M0_______________________/____GPIO0_A5_d) ; port USB_OTG_PWREN_H_GPIO0_A5
NetR204_1: U8.AC22(I2C2_SCL_M0_____/_SPI0_CLK_M0_______/_PCIE20_WAKEn_M0________/_PWM1_M1_____________/____GPIO0_B5_u) ; port RDY-ADC

Not connected (* = marked no-connect by the designer): U8 AA20(I2C2_SDA_M0______/_SPI0_MOSI_M0______/_PCIE20_PERSTn_M0_______/_PWM2_M1______________/____GPIO0_B6_u)* AB23(GPIO0_D4_d)* AC24(GPIO0_D6_d)* AD23(CLK32K_IN_____/__CLK32K_OUT0____________/__PCIE30X2_BUTTONRSTn_______________________/______GPIO0_B0_u____)* AD25(GPIO0_D5_d)* AH25(HDMITX_CEC_M1___/_PWM0_M1_______________/_UART0_CTSN__________________________________________________________________/_GPIO0_C7_d)* AH26(PWM0_M0______/_____CPUAVS____/______________________________________________________________________________________________________GPIO0_B7_d)* Y22(SDMMC0_DET_______/__SATA_CP_DET______/__PCIE30X1_CLKREQn_M0______________________/___GPIO0_A4_u)*

### Notes on the sheet
- RK3568 OSC/PLL/PMUIO1/2
- Note:
  Caps of between dashed black lines and U1 should be placed under the U1 package. Other caps should be placed close to the U1 package.
- File:
- Title:
- Date:
- Page
- Num:
- Total:
- Drawn By: Huzaifa Ali
- (in symbol RK3568B2, part G) PMUIO1 Domain; OSC; Operating Voltage=3.3V Only; Operating Voltage / =1.8V (PMUPLL_AVDD_1V8); PMUIO2 Domain; PMU PLL; Operating Voltage=1.8V/3.3V; SYS PLL; PMUIO1/2/OSC Domain Logic Power; Operating Voltage=0.9V

### Library data of the parts
C118 C123 = GRM1555C1H100JA01D: CAP CER 10PF 50V C0G/NP0 0402; Manufacturer: Murata; Material: Ceramic; Dielectric: C0G; Tolerance: 5%; Item Type: Capacitor; Supplier: Arrow Electronics; Supplier Part Number: GRM1555C1H100JA01D; Manufacturer Part Number: GRM1555C1H100JA01D; RoHS: Yes; Category: Ceramic Capacitors; Stock: 3860000; Pricing: 10000=0.0034, 50000=0.0027, 100000=0.0023, 250000=0.0021 (USD); Mounting Technology: Surface Mount; Case/Package: 0402; Case Code (Metric): 1005; Case Code (Imperial): 0402; Min Operating Temperature: -55°C; Max Operating Temperature: 125°C; Value: 10pF; Voltage Rating: 50V; Packaging: Tape and Reel; Package Quantity: 1; Voltage Rating (DC): 50V; Termination: SMD/SMT; Series: GRM; Voltage: 50V; Construction: Flat; Length: 1mm; Width: 0.02inch; Height: 0.5mm; Depth: 0.5mm; Thickness: 0.022inch; Radiation Hardening: No; RoHS Compliant: Yes; Lead Free: Lead Free; Reach SVHC Compliant: No; ComponentLink1URL: https://datasheet.ciiva.com/2989/product-2989280.pdf?src-supplier=Avnet; ComponentLink1Description: https://datasheet.ciiva.com/2989/product-2989280.pdf?src-supplier=Avnet; ComponentLink2URL: https://datasheet.ciiva.com/18184/getdatasheetpartid-307234-18184164.pdf?src-supplier=Verical; ComponentLink2Description: https://datasheet.ciiva.com/18184/getdatasheetpartid-307234-18184164.pdf?src-supplier=Verical; ComponentLink3URL: https://datasheet.ciiva.com/29200/453545-da-01-en-vs-kondensator-0402-29200107.pdf?src-supplier=Conrad; ComponentLink3Description: https://datasheet.ciiva.com/29200/453545-da-01-en-vs-kondensator-0402-29200107.pdf?src-supplier=Conrad; ComponentLink4URL: https://datasheet.ciiva.com/7828/1666664-7828812.pdf?src-supplier=Element14; ComponentLink4Description: https://datasheet.ciiva.com/7828/1666664-7828812.pdf?src-supplier=Element14; ComponentLink5URL: https://datasheet.ciiva.com/6271/partnumbering-e-01-6271159.pdf?src-supplier=Digi-Key; ComponentLink5Description: https://datasheet.ciiva.com/6271/partnumbering-e-01-6271159.pdf?src-supplier=Digi-Key; ComponentLink6URL: https://datasheet.ciiva.com/6271/partnumbering-e-01-6271158.pdf?src-supplier=Digi-Key; ComponentLink6Description: https://datasheet.ciiva.com/6271/partnumbering-e-01-6271158.pdf?src-supplier=Digi-Key; ComponentLink7URL: https://datasheet.ciiva.com/6271/partnumbering-e-01-6271068.pdf?src-supplier=Digi-Key; ComponentLink7Description: https://datasheet.ciiva.com/6271/partnumbering-e-01-6271068.pdf?src-supplier=Digi-Key; LCSC Part Number: C76946
C119-C122 C132 = CC0402KRX5R6BB105: CAP CER 1UF 10V X5R 0402; Manufacturer: Yageo; Tolerance: 10%; Dissipation Factor: 15%; Item Type: Capacitor; Supplier 1: Mouser; Manufacturer Part Number: CC0402KRX5R6BB105; RoHS: Yes; Category: Ceramic Capacitors; Stock 1: 6711367; Pricing 1: 1=0.11000, 10=0.05500, 50=0.05500, 100=0.03300, 500=0.02700, 1000=0.02200, 2500=0.02100, 10000=0.01800 (USD); Mount: Surface Mount; Case/Package: 0402; Number of Pins: 2; Case Code (Metric): 1005; Case Code (Imperial): 0402; Min Operating Temperature: -55°C; Max Operating Temperature: 85°C; Capacitance: 1uF; Dielectric: X5R; Package Quantity: 1; Voltage Rating: 10V; Packaging: Tape and Reel; Voltage Rating (DC): 10V; Termination: SMD/SMT; Resistor Type: Ceramic; Series: CC; Construction: Flat; Length: 1mm; Width: 0.02inch; Height: 0.5mm; Thickness: 0.022inch; Depth: 0.5mm; Radiation Hardening: No; REACH SVHC: No SVHC; Lead Free: Lead Free; Halogen Free: Halogen Free; RoHS Compliant: Yes; ComponentLink1URL: https://datasheet.ciiva.com/176/upy-gphc-x5r-4v-to-50v-12-176704.pdf?src-supplier=Digi-Key; ComponentLink1Description: https://datasheet.ciiva.com/176/upy-gphc-x5r-4v-to-50v-12-176704.pdf?src-supplier=Digi-Key; ComponentLink2URL: https://datasheet.ciiva.com/176/mlccorderingcode-176705.pdf?src-supplier=Digi-Key; ComponentLink2Description: https://datasheet.ciiva.com/176/mlccorderingcode-176705.pdf?src-supplier=Digi-Key; ComponentLink3URL: https://datasheet.ciiva.com/176/mlccorderingcode-176706.pdf?src-supplier=Digi-Key; ComponentLink3Description: https://datasheet.ciiva.com/176/mlccorderingcode-176706.pdf?src-supplier=Digi-Key; Supplier Part Number 1: 603-CC402KRX5R6BB105; LCSC Part Number: C106254
C124-C131 = CC0201KRX5R6BB104: CAP CER 0.1UF 10V X5R 0201; Manufacturer: Yageo; Tolerance: 10%; Supplier 1: Mouser; Manufacturer Part Number: CC0201KRX5R6BB104; RoHS: Yes; Category: Ceramic Capacitors; Stock 1: 824403; Pricing 1: 1=0.10000, 10=0.02400, 50=0.02400, 100=0.01900, 1000=0.01100, 10000=0.00900 (USD); Mount: Surface Mount; Case/Package: 0201; Case Code (Imperial): 0201; Case Code (Metric): 0603; Weight: 6E-06oz; Min Operating Temperature: -55°C; Max Operating Temperature: 85°C; Capacitance: 100nF; Dielectric: X5R; Voltage Rating (DC): 10V; Packaging: Tape and Reel; Termination: SMD/SMT; Resistor Type: Ceramic; Voltage Rating: 10V; Series: CC; Construction: Flat; Length: 0.6mm; Width: 0.012inch; Height: 0.3mm; Thickness: 0.013inch; Depth: 0.3mm; Radiation Hardening: No; Lead Free: Lead Free; Halogen Free: Halogen Free; RoHS Compliant: Yes; ComponentLink1URL: https://datasheet.ciiva.com/11587/upy-gphc-x5r-4v-to-50v-12-11587190.pdf?src-supplier=Avnet; ComponentLink1Description: https://datasheet.ciiva.com/11587/upy-gphc-x5r-4v-to-50v-12-11587190.pdf?src-supplier=Avnet; Supplier Part Number 1: 603-CC201KRX5R6BB104; LCSC Part Number: C190183
R41 = RC0402FR-0722RL: RES 22 OHM 1% 1/16W 0402; Manufacturer: Yageo; Voltage Rating: 50V; Power Rating: 62.5mW; Temperature Coefficient: 100ppm/°C; Max Power Dissipation: 63mW; Item Type: Resistor; Supplier 1: Avnet; Manufacturer Part Number: RC0402FR-0722RL; RoHS: Yes; Category: Chip SMD Resistors; Stock 1: 1810000; Pricing 1: 10000=0.00085 (USD); Case/Package: 0402; Number of Pins: 2; Case Code (Imperial): 0402; Case Code (Metric): 1005; Size Code: 0402; Min Operating Temperature: -55°C; Max Operating Temperature: 155°C; Resistor Type: Thick Film; Voltage Rating (DC): 50V; Resistance: 22R; Tolerance: 1%; Packaging: Tape and Reel; Termination: SMD/SMT; Features: Moisture Resistant; Series: RC; Number of Terminations: 2; Resistance Tolerance: 1%; Technology: THICK FILM; Construction: Rectangular; Length: 1mm; Width: 0.5mm; Height: 0.32mm; Depth: 0.5mm; RoHS Compliant: Yes; Reach SVHC Compliant: Yes; Military Standard: Not; Lead Free: Lead Free; ComponentLink1URL: https://datasheet.ciiva.com/11819/0900766b80c66297-11819462.pdf?src-supplier=RSComponents; ComponentLink1Description: https://datasheet.ciiva.com/11819/0900766b80c66297-11819462.pdf?src-supplier=RSComponents; ComponentLink2URL: https://datasheet.ciiva.com/7849/1018594-7849912.pdf?src-supplier=Element14; ComponentLink2Description: https://datasheet.ciiva.com/7849/1018594-7849912.pdf?src-supplier=Element14; ComponentLink3URL: https://datasheet.ciiva.com/7849/1018594-7849911.pdf?src-supplier=Element14; ComponentLink3Description: https://datasheet.ciiva.com/7849/1018594-7849911.pdf?src-supplier=Element14; ComponentLink4URL: https://datasheet.ciiva.com/16930/pyu-rc0402-51-rohs-l-6-r-16930687.pdf?src-supplier=Future+Electronics; ComponentLink4Description: https://datasheet.ciiva.com/16930/pyu-rc0402-51-rohs-l-6-r-16930687.pdf?src-supplier=Future+Electronics; ComponentLink5URL: https://datasheet.ciiva.com/26829/getdatasheetpartid-554995-26829991.pdf?src-supplier=Verical; ComponentLink5Description: https://datasheet.ciiva.com/26829/getdatasheetpartid-554995-26829991.pdf?src-supplier=Verical; Supplier Part Number 1: RC0402FR-0722RL; LCSC Part Number: C114765
R42 R52 = RC0402FR-0710KL: RES 10K OHM 1% 1/16W 0402; Manufacturer: Yageo; Resistance: 10kR; Voltage Rating (DC): 50V; Temperature Coefficient: 100ppm/°C; Power Rating: 62.5mW; Max Power Dissipation: 63mW; Item Type: Resistor; Supplier 1: Mouser; Manufacturer Part Number: RC0402FR-0710KL; RoHS: Yes; Category: Chip SMD Resistors; Stock 1: 18648329; Pricing 1: 1=0.10000, 10=0.01400, 50=0.01400, 100=0.00500, 1000=0.00300, 10000=0.00200 (USD); Case/Package: 0402; Number of Pins: 2; Case Code (Imperial): 0402; Case Code (Metric): 1005; Min Operating Temperature: -55°C; Max Operating Temperature: 155°C; Resistor Type: Thick Film; Tolerance: 1%; Packaging: Tape and Reel; Voltage Rating: 50V; Termination: SMD/SMT; Working Voltage: 50V; Number of Terminations: 2; Features: Moisture Resistant; Series: RC; Resistance Tolerance: 1%; Construction: Rectangular; Length: 1mm; Width: 0.5mm; Height: 0.32mm; Depth: 0.5mm; Lead Pitch: 0.2mm; REACH SVHC: No SVHC; Lead Free: Lead Free; RoHS Compliant: Yes; Military Standard: Not; ComponentLink1URL: https://datasheet.ciiva.com/7660/38568-7660787.pdf?src-supplier=Element14; ComponentLink1Description: https://datasheet.ciiva.com/7660/38568-7660787.pdf?src-supplier=Element14; ComponentLink2URL: https://datasheet.ciiva.com/7849/1686128-7849814.pdf?src-supplier=Element14; ComponentLink2Description: https://datasheet.ciiva.com/7849/1686128-7849814.pdf?src-supplier=Element14; ComponentLink3URL: https://datasheet.ciiva.com/7983/1018594-7983486.pdf?src-supplier=Element14; ComponentLink3Description: https://datasheet.ciiva.com/7983/1018594-7983486.pdf?src-supplier=Element14; ComponentLink4URL: https://datasheet.ciiva.com/22747/1018594-22747512.pdf?src-supplier=Element14; ComponentLink4Description: https://datasheet.ciiva.com/22747/1018594-22747512.pdf?src-supplier=Element14; ComponentLink5URL: https://datasheet.ciiva.com/12667/pyu-rc0402-51-rohs-l-6-r-12667067.pdf?src-supplier=Mouser; ComponentLink5Description: https://datasheet.ciiva.com/12667/pyu-rc0402-51-rohs-l-6-r-12667067.pdf?src-supplier=Mouser; ComponentLink6URL: https://datasheet.ciiva.com/7849/1784430-7849813.pdf?src-supplier=Element14; ComponentLink6Description: https://datasheet.ciiva.com/7849/1784430-7849813.pdf?src-supplier=Element14; ComponentLink7URL: https://datasheet.ciiva.com/7849/1784430-7849815.pdf?src-supplier=Element14; ComponentLink7Description: https://datasheet.ciiva.com/7849/1784430-7849815.pdf?src-supplier=Element14; Supplier Part Number 1: 603-RC0402FR-0710KL; LCSC Part Number: C60490
R43 = RC0402FR-071ML: RES 1M OHM 1% 1/16W 0402; Manufacturer: Yageo; Value: 1MR; Power Rating: 63mW; Voltage Rating: 50V; Temperature Coefficient: 100ppm/°C; Item Type: Resistor; Supplier: Digikey; Supplier Part Number: 311-1.00MLRCT-ND; Manufacturer Part Number: RC0402FR-071ML; RoHS: Yes; Category: Chip SMD Resistors; Stock: 6516; Pricing: 1=0.1, 10=0.015, 50=0.0088, 100=0.0073, 500=0.00488, 1000=0.00417, 5000=0.00297 (USD); Case/Package: 0402; Case Code (Imperial): 0402; Case Code (Metric): 1005; Min Operating Temperature: -55°C; Max Operating Temperature: 155°C; Resistor Type: Thick Film; Packaging: Tape and Reel; Tolerance: 1%; Termination: SMD/SMT; Features: Moisture Resistant; Series: RC; Max Power Dissipation: 63mW; Number of Terminations: 2; Resistance Tolerance: 1%; Construction: Rectangular; Technology: THICK FILM; Voltage Rating (AC): 50V; Length: 1mm; Height: 0.32mm; Depth: 0.5mm; RoHS Compliant: Yes; Military Standard: Not; Reach SVHC Compliant: Unknown; Lead Free: 5697LeadFree; ComponentLink1URL: https://datasheet.ciiva.com/11808/0900766b80c66297-11808125.pdf?src-supplier=Rs; ComponentLink1Description: https://datasheet.ciiva.com/11808/0900766b80c66297-11808125.pdf?src-supplier=Rs; ComponentLink2URL: https://datasheet.ciiva.com/46394/1018594-46394951.pdf?src-supplier=Element14; ComponentLink2Description: https://datasheet.ciiva.com/46394/1018594-46394951.pdf?src-supplier=Element14; ComponentLink3URL: https://datasheet.ciiva.com/7849/1018594-7849883.pdf?src-supplier=Element14; ComponentLink3Description: https://datasheet.ciiva.com/7849/1018594-7849883.pdf?src-supplier=Element14; ComponentLink4URL: https://datasheet.ciiva.com/7849/1018594-7849882.pdf?src-supplier=Element14; ComponentLink4Description: https://datasheet.ciiva.com/7849/1018594-7849882.pdf?src-supplier=Element14; ComponentLink5URL: https://datasheet.ciiva.com/16741/pyu-rc0402-51-rohs-l-6-r-16741081.pdf?src-supplier=Future+Electronics; ComponentLink5Description: https://datasheet.ciiva.com/16741/pyu-rc0402-51-rohs-l-6-r-16741081.pdf?src-supplier=Future+Electronics; LCSC Part Number: C138033
R44 = RC0201FR-07120RL: RES 120 OHM 1% 1/20W 0201; Manufacturer: Yageo; Item Type: Resistor; Supplier: Digikey; Supplier Part Number: 311-120MCT-ND; Manufacturer Part Number: RC0201FR-07120RL; RoHS: Yes; Category: Chip SMD Resistors; Stock: 38339; Pricing: 1=0.1, 10=0.027, 50=0.0172, 100=0.0143, 500=0.00988, 1000=0.00854, 5000=0.00629 (USD); Lead Free: 5697LeadFree; ComponentLink1URL: https://datasheet.ciiva.com/2525/pyu-r-int-thick-7-2525064.pdf?src-supplier=Digikey; ComponentLink1Description: https://datasheet.ciiva.com/2525/pyu-r-int-thick-7-2525064.pdf?src-supplier=Digikey; ComponentLink2URL: https://datasheet.ciiva.com/22661/1563626-22661285.pdf?src-supplier=Element14; ComponentLink2Description: https://datasheet.ciiva.com/22661/1563626-22661285.pdf?src-supplier=Element14; ComponentLink3URL: https://datasheet.ciiva.com/2525/pyu-r-int-thick-7-2525062.pdf?src-supplier=Digikey; ComponentLink3Description: https://datasheet.ciiva.com/2525/pyu-r-int-thick-7-2525062.pdf?src-supplier=Digikey; ComponentLink4URL: https://datasheet.ciiva.com/2525/pyu-r-int-thick-7-2525063.pdf?src-supplier=Digikey; ComponentLink4Description: https://datasheet.ciiva.com/2525/pyu-r-int-thick-7-2525063.pdf?src-supplier=Digikey; LCSC Part Number: C295718
R45 = RC0402FR-070RL: RES 0 OHM JUMPER 1/16W 0402; Manufacturer: Yageo; Tolerance: 1%; Power Rating: 62.5mW; Voltage Rating: 50V; Temperature Coefficient: 200ppm/°C; Max Power Dissipation: 63mW; Supplier 1: Mouser; Manufacturer Part Number: RC0402FR-070RL; RoHS: Yes; Category: Chip SMD Resistors; Stock 1: 8556842; Pricing 1: 1=0.10000, 10=0.01400, 50=0.01400, 100=0.00600, 1000=0.00300, 5000=0.00200, 10000=0.00100 (USD); Mount: Surface Mount; Case/Package: 0402; Contact Plating: Tin,Matte; Case Code (Imperial): 0402; Case Code (Metric): 1005; Size Code: 0402; Min Operating Temperature: -55°C; Max Operating Temperature: 155°C; Resistance: 0R; Resistor Type: Thick Film; Packaging: Tape and Reel; Termination: SMD/SMT; Features: Moisture Resistant; Series: RC; Number of Terminations: 2; Length: 1mm; Width: 0.5mm; Height: 0.35mm; Radiation Hardening: No; Lead Free: Lead Free; RoHS Compliant: Yes; ComponentLink1URL: https://datasheet.ciiva.com/8896/pyu-rc0402-51-rohs-l-6-8896149.pdf?src-supplier=Avnet; ComponentLink1Description: https://datasheet.ciiva.com/8896/pyu-rc0402-51-rohs-l-6-8896149.pdf?src-supplier=Avnet; ComponentLink2URL: https://datasheet.ciiva.com/16790/pyu-rc0402-51-rohs-l-6-r-16790444.pdf?src-supplier=Future+Electronics; ComponentLink2Description: https://datasheet.ciiva.com/16790/pyu-rc0402-51-rohs-l-6-r-16790444.pdf?src-supplier=Future+Electronics; Supplier Part Number 1: 603-RC0402FR-070RL; LCSC Part Number: C106231
R46-R49 = RC0402FR-072K2L: RES SMD 2.2K OHM 1% 1/16W 0402; Manufacturer: Yageo; Resistance: 2.2kR; Power Rating: 63mW; Voltage Rating: 50V; Temperature Coefficient: 100ppm/°C; Supplier 1: Digi-Key; Manufacturer Part Number: RC0402FR-072K2L; Stock 1: 966157; Pricing 1: 1=0.1, 10=0.016, 100=0.0066, 1000=0.00299, 2500=0.00259, 5000=0.00214 (USD); Case/Package: 0402; Case Code (Imperial): 0402; Case Code (Metric): 1005; Weight: 2.3E-05oz; Size Code: 0402; Min Operating Temperature: -55°C; Max Operating Temperature: 155°C; Resistor Type: Thick Film; Packaging: Tape and Reel; Tolerance: 1%; Termination: SMD/SMT; Features: Moisture Resistant; Series: RC; Max Power Dissipation: 63mW; Number of Terminations: 2; Resistance Tolerance: 1%; Construction: Rectangular; Technology: THICK FILM; Length: 1mm; Width: 0.5mm; Height: 0.35mm; Depth: 0.5mm; RoHS Compliant: Yes; REACH SVHC: Unknown; Military Standard: Not; Lead Free: Lead Free; ComponentLink1URL: http://www.farnell.com/datasheets/2167052.pdf?src-supplier=Element14; ComponentLink1Description: http://www.farnell.com/datasheets/2167052.pdf?src-supplier=Element14; ComponentLink2URL: http://www.yageo.com/documents/recent/PYu-RC_Group_51_RoHS_L_9.pdf?src-supplier=Mouser; ComponentLink2Description: http://www.yageo.com/documents/recent/PYu-RC_Group_51_RoHS_L_9.pdf?src-supplier=Mouser; ComponentLink3URL: http://documents.rs-components.com/techlib://itc_doclist_GB.htm?stockno=6186532&src-supplier=RSComponents; ComponentLink3Description: http://documents.rs-components.com/techlib://itc_doclist_GB.htm?stockno=6186532&src-supplier=RSComponents; ComponentLink4URL: http://www.yageo.com/documents/recent/PYu-RC0402_51_RoHS_L_6_r.pdf?src-supplier=Future+Electronics; ComponentLink4Description: http://www.yageo.com/documents/recent/PYu-RC0402_51_RoHS_L_6_r.pdf?src-supplier=Future+Electronics; Supplier Part Number 1: 311-2.20KLRCT-ND; LCSC Part Number: C114762
R50 = RC0402FR-07100KL: RES 100K OHM 1% 1/16W 0402; Manufacturer: Yageo; Resistance: 100kR; Temperature Coefficient: 100ppm/°C; Power Rating: 63mW; Voltage Rating: 50V; Item Type: Resistor; Supplier 1: Mouser; Manufacturer Part Number: RC0402FR-07100KL; RoHS: Yes; Category: Chip SMD Resistors; Stock 1: 7759549; Pricing 1: 1=0.10000, 10=0.01200, 50=0.01200, 100=0.00500, 1000=0.00300, 2500=0.00200, 10000=0.00100 (USD); Case/Package: 0402; Case Code (Metric): 1005; Case Code (Imperial): 0402; Min Operating Temperature: -55°C; Max Operating Temperature: 155°C; Resistor Type: Thick Film; Tolerance: 1%; Packaging: Tape and Reel; Package Quantity: 1; Number of Terminations: 2; Termination: SMD/SMT; Max Power Dissipation: 63mW; Working Voltage: 50V; Features: Moisture Resistant; Series: RC; Resistance Tolerance: 1%; Construction: Rectangular; Technology: THICK FILM; Length: 0.039inch; Width: 0.02inch; Height: 0.016inch; Depth: 0.5mm; REACH SVHC: No SVHC; Lead Free: Lead Free; RoHS Compliant: Yes; Military Standard: Not; ComponentLink1URL: https://datasheet.ciiva.com/11819/0900766b80c66297-11819452.pdf?src-supplier=RSComponents; ComponentLink1Description: https://datasheet.ciiva.com/11819/0900766b80c66297-11819452.pdf?src-supplier=RSComponents; ComponentLink2URL: https://datasheet.ciiva.com/22747/1018594-22747509.pdf?src-supplier=Element14; ComponentLink2Description: https://datasheet.ciiva.com/22747/1018594-22747509.pdf?src-supplier=Element14; ComponentLink3URL: https://datasheet.ciiva.com/2453/pyu-r-int-thick-7-2453362.pdf?src-supplier=Digi-Key; ComponentLink3Description: https://datasheet.ciiva.com/2453/pyu-r-int-thick-7-2453362.pdf?src-supplier=Digi-Key; ComponentLink4URL: https://datasheet.ciiva.com/2453/pyu-r-int-thick-7-2453363.pdf?src-supplier=Digi-Key; ComponentLink4Description: https://datasheet.ciiva.com/2453/pyu-r-int-thick-7-2453363.pdf?src-supplier=Digi-Key; ComponentLink5URL: https://datasheet.ciiva.com/2453/pyu-r-int-thick-7-2453361.pdf?src-supplier=Digi-Key; ComponentLink5Description: https://datasheet.ciiva.com/2453/pyu-r-int-thick-7-2453361.pdf?src-supplier=Digi-Key; ComponentLink6URL: https://datasheet.ciiva.com/12667/pyu-rc0402-51-rohs-l-6-r-12667930.pdf?src-supplier=Mouser; ComponentLink6Description: https://datasheet.ciiva.com/12667/pyu-rc0402-51-rohs-l-6-r-12667930.pdf?src-supplier=Mouser; ComponentLink7URL: https://datasheet.ciiva.com/15189/getdatasheetpartid-323696-15189334.pdf?src-supplier=Verical; ComponentLink7Description: https://datasheet.ciiva.com/15189/getdatasheetpartid-323696-15189334.pdf?src-supplier=Verical; Supplier Part Number 1: 603-RC0402FR-07100KL; LCSC Part Number: C60491
R51 = RC0402FR-074K7L: RES 4.7K OHM 1% 1/16W 0402; Manufacturer: Yageo; Voltage Rating (DC): 50V; Power Rating: 62.5mW; Resistance: 4.7kR; Temperature Coefficient: 100ppm/°C; Max Power Dissipation: 63mW; Item Type: Resistor; Supplier 1: Avnet; Manufacturer Part Number: RC0402FR-074K7L; RoHS: Yes; Category: Chip SMD Resistors; Stock 1: 2420000; Pricing 1: 10000=0.00085 (USD); Case/Package: 0402; Number of Pins: 2; Case Code (Imperial): 0402; Case Code (Metric): 1005; Size Code: 0402; Min Operating Temperature: -55°C; Max Operating Temperature: 155°C; Tolerance: 1%; Voltage Rating: 50V; Packaging: Tape and Reel; Resistor Type: Thick Film; Termination: SMD/SMT; Features: Moisture Resistant; Series: RC; Number of Terminations: 2; Resistance Tolerance: 1%; Construction: Rectangular; Length: 1mm; Width: 0.5mm; Height: 0.32mm; Depth: 0.5mm; Height - Seated (Max): 0.016inch; RoHS Compliant: Yes; Reach SVHC Compliant: Yes; Military Standard: Not; Lead Free: Lead Free; ComponentLink1URL: https://datasheet.ciiva.com/22661/1686128-22661342.pdf?src-supplier=Element14; ComponentLink1Description: https://datasheet.ciiva.com/22661/1686128-22661342.pdf?src-supplier=Element14; ComponentLink2URL: https://datasheet.ciiva.com/7850/1018594-7850022.pdf?src-supplier=Element14; ComponentLink2Description: https://datasheet.ciiva.com/7850/1018594-7850022.pdf?src-supplier=Element14; ComponentLink3URL: https://datasheet.ciiva.com/7850/1018594-7850023.pdf?src-supplier=Element14; ComponentLink3Description: https://datasheet.ciiva.com/7850/1018594-7850023.pdf?src-supplier=Element14; ComponentLink4URL: https://datasheet.ciiva.com/15215/getdatasheetpartid-328119-15215035.pdf?src-supplier=Verical; ComponentLink4Description: https://datasheet.ciiva.com/15215/getdatasheetpartid-328119-15215035.pdf?src-supplier=Verical; Supplier Part Number 1: RC0402FR-074K7L; LCSC Part Number: C105871
U8 = RK3568B2: FCCSP-636L Microcontroller Units (MCUs/MPUs/SOCs) ROHS; Manufacturer: Rockchip; Item Type: IC; Manufacturer Part Number: RK3568B2; Package: FCCSP-636L; LCSC Part Number: C3345225
X2 = E3SB24E000009E: 24MHz 8pF ±10ppm SMD3225-4P Crystals ROHS; Manufacturer: Hosonic Elec; Manufacturer Part Number: E3SB24E000009E; Package: SMD3225-4P; LCSC Part Number: C5241161; Item Type: Crystal; ComponentLink1Description: LCSC; ComponentLink1URL: https://www.lcsc.com/product-detail/Crystals_Hosonic-Elec-E3SB24E000009E_C5241161.html